# Altium schematic sheet Altium_Schematic.schdoc (part 6 of 6)
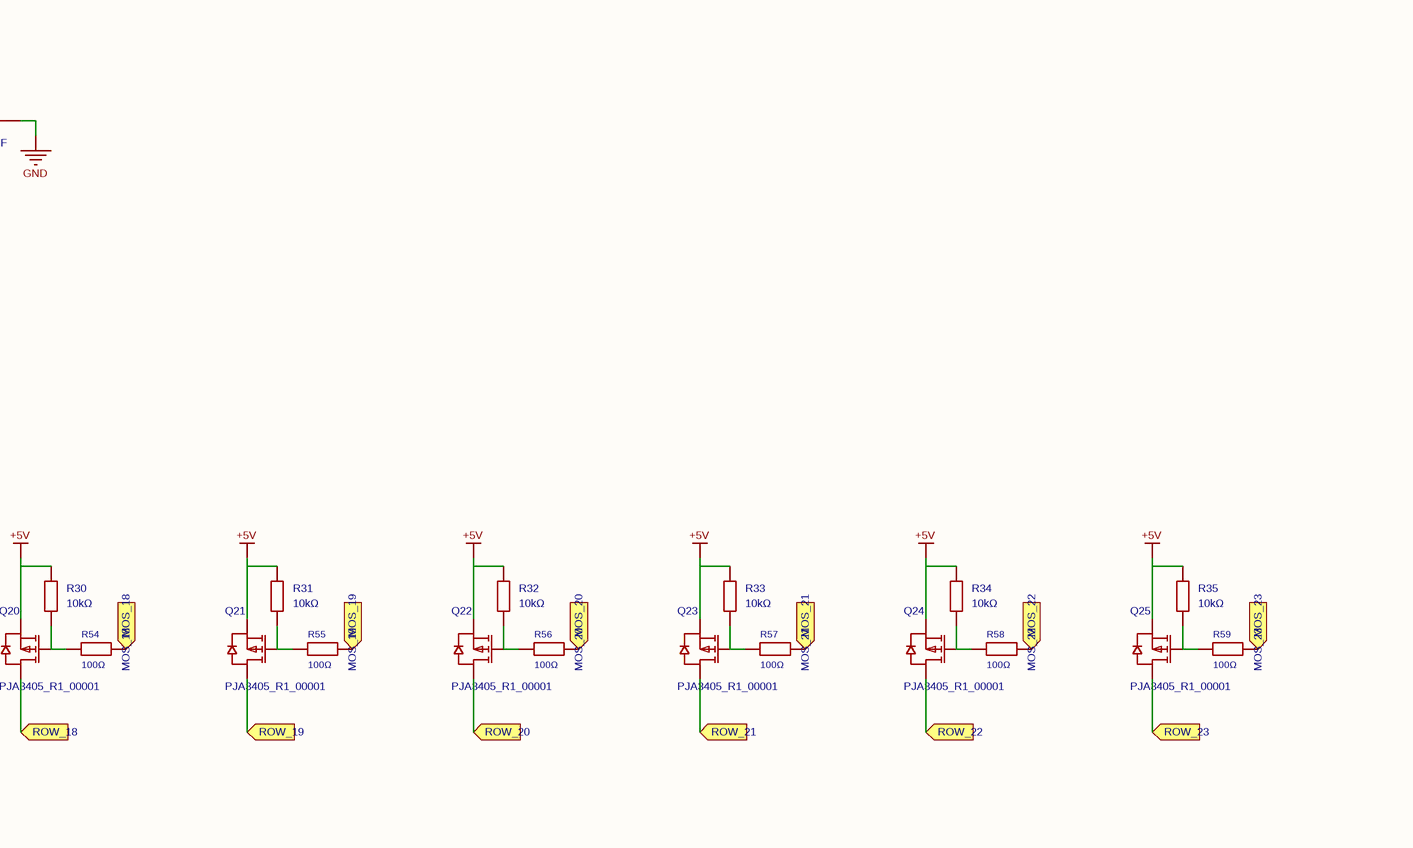
[diagram p16: Altium_Schematic.schdoc, bottom column 4 of 4]

## Nets (continued)
ROW_20: LED1441.1(A) LED1442.1(A) LED1443.1(A) LED1444.1(A) LED1445.1(A) LED1446.1(A) LED1447.1(A) LED1448.1(A) LED1449.1(A) LED1450.1(A) LED1451.1(A) LED1452.1(A) LED1453.1(A) LED1454.1(A) LED1455.1(A) LED1456.1(A) LED1457.1(A) LED1458.1(A) LED1459.1(A) LED1460.1(A) LED1461.1(A) LED1462.1(A) LED1463.1(A) LED1464.1(A) LED1465.1(A) LED1466.1(A) LED1467.1(A) LED1468.1(A) LED1469.1(A) LED1470.1(A) LED1471.1(A) LED1472.1(A) LED1473.1(A) LED1474.1(A) LED1475.1(A) LED1476.1(A) LED1477.1(A) LED1478.1(A) LED1479.1(A) LED1480.1(A) LED1481.1(A) LED1482.1(A) LED1483.1(A) LED1484.1(A) LED1485.1(A) LED1486.1(A) LED1487.1(A) LED1488.1(A) LED1489.1(A) LED1490.1(A) LED1491.1(A) LED1492.1(A) LED1493.1(A) LED1494.1(A) LED1495.1(A) LED1496.1(A) LED1497.1(A) LED1498.1(A) LED1499.1(A) LED1500.1(A) LED1501.1(A) LED1502.1(A) LED1503.1(A) LED1504.1(A) LED1505.1(A) LED1506.1(A) LED1507.1(A) LED1508.1(A) LED1509.1(A) LED1510.1(A) LED1511.1(A) LED1512.1(A) Q22.3(D) ; port ROW_20
ROW_21: LED1513.1(A) LED1514.1(A) LED1515.1(A) LED1516.1(A) LED1517.1(A) LED1518.1(A) LED1519.1(A) LED1520.1(A) LED1521.1(A) LED1522.1(A) LED1523.1(A) LED1524.1(A) LED1525.1(A) LED1526.1(A) LED1527.1(A) LED1528.1(A) LED1529.1(A) LED1530.1(A) LED1531.1(A) LED1532.1(A) LED1533.1(A) LED1534.1(A) LED1535.1(A) LED1536.1(A) LED1537.1(A) LED1538.1(A) LED1539.1(A) LED1540.1(A) LED1541.1(A) LED1542.1(A) LED1543.1(A) LED1544.1(A) LED1545.1(A) LED1546.1(A) LED1547.1(A) LED1548.1(A) LED1549.1(A) LED1550.1(A) LED1551.1(A) LED1552.1(A) LED1553.1(A) LED1554.1(A) LED1555.1(A) LED1556.1(A) LED1557.1(A) LED1558.1(A) LED1559.1(A) LED1560.1(A) LED1561.1(A) LED1562.1(A) LED1563.1(A) LED1564.1(A) LED1565.1(A) LED1566.1(A) LED1567.1(A) LED1568.1(A) LED1569.1(A) LED1570.1(A) LED1571.1(A) LED1572.1(A) LED1573.1(A) LED1574.1(A) LED1575.1(A) LED1576.1(A) LED1577.1(A) LED1578.1(A) LED1579.1(A) LED1580.1(A) LED1581.1(A) LED1582.1(A) LED1583.1(A) LED1584.1(A) Q23.3(D) ; port ROW_21
ROW_22: LED1585.1(A) LED1586.1(A) LED1587.1(A) LED1588.1(A) LED1589.1(A) LED1590.1(A) LED1591.1(A) LED1592.1(A) LED1593.1(A) LED1594.1(A) LED1595.1(A) LED1596.1(A) LED1597.1(A) LED1598.1(A) LED1599.1(A) LED1600.1(A) LED1601.1(A) LED1602.1(A) LED1603.1(A) LED1604.1(A) LED1605.1(A) LED1606.1(A) LED1607.1(A) LED1608.1(A) LED1609.1(A) LED1610.1(A) LED1611.1(A) LED1612.1(A) LED1613.1(A) LED1614.1(A) LED1615.1(A) LED1616.1(A) LED1617.1(A) LED1618.1(A) LED1619.1(A) LED1620.1(A) LED1621.1(A) LED1622.1(A) LED1623.1(A) LED1624.1(A) LED1625.1(A) LED1626.1(A) LED1627.1(A) LED1628.1(A) LED1629.1(A) LED1630.1(A) LED1631.1(A) LED1632.1(A) LED1633.1(A) LED1634.1(A) LED1635.1(A) LED1636.1(A) LED1637.1(A) LED1638.1(A) LED1639.1(A) LED1640.1(A) LED1641.1(A) LED1642.1(A) LED1643.1(A) LED1644.1(A) LED1645.1(A) LED1646.1(A) LED1647.1(A) LED1648.1(A) LED1649.1(A) LED1650.1(A) LED1651.1(A) LED1652.1(A) LED1653.1(A) LED1654.1(A) LED1655.1(A) LED1656.1(A) Q24.3(D) ; port ROW_22
ROW_23: LED1657.1(A) LED1658.1(A) LED1659.1(A) LED1660.1(A) LED1661.1(A) LED1662.1(A) LED1663.1(A) LED1664.1(A) LED1665.1(A) LED1666.1(A) LED1667.1(A) LED1668.1(A) LED1669.1(A) LED1670.1(A) LED1671.1(A) LED1672.1(A) LED1673.1(A) LED1674.1(A) LED1675.1(A) LED1676.1(A) LED1677.1(A) LED1678.1(A) LED1679.1(A) LED1680.1(A) LED1681.1(A) LED1682.1(A) LED1683.1(A) LED1684.1(A) LED1685.1(A) LED1686.1(A) LED1687.1(A) LED1688.1(A) LED1689.1(A) LED1690.1(A) LED1691.1(A) LED1692.1(A) LED1693.1(A) LED1694.1(A) LED1695.1(A) LED1696.1(A) LED1697.1(A) LED1698.1(A) LED1699.1(A) LED1700.1(A) LED1701.1(A) LED1702.1(A) LED1703.1(A) LED1704.1(A) LED1705.1(A) LED1706.1(A) LED1707.1(A) LED1708.1(A) LED1709.1(A) LED1710.1(A) LED1711.1(A) LED1712.1(A) LED1713.1(A) LED1714.1(A) LED1715.1(A) LED1716.1(A) LED1717.1(A) LED1718.1(A) LED1719.1(A) LED1720.1(A) LED1721.1(A) LED1722.1(A) LED1723.1(A) LED1724.1(A) LED1725.1(A) LED1726.1(A) LED1727.1(A) LED1728.1(A) Q25.3(D) ; port ROW_23
ROW_EN_OUT: Q1.3(D) R8.2 U7.13(OE#) U8.13(OE#) U9.13(OE#) ; port ROW_EN_OUT
ROW_LATCH: U6.20(IO6) U7.12(STCP) U8.12(STCP) U9.12(STCP) ; port ROW_LATCH
ROW_OE: R10.1 U6.6(IO3) ; port ROW_OE
SOUT_1: U1.22(SOUT) U2.2(SIN) ; port SOUT_1
SOUT_2: U2.22(SOUT) U3.2(SIN) ; port SOUT_2
SOUT_3: U3.22(SOUT) U4.2(SIN) ; port SOUT_3
SOUT_4: U4.22(SOUT) U5.2(SIN) ; port SOUT_4
SPI_MOSI: U1.2(SIN) U6.19(IO5) U7.14(DS) ; port SPI_MOSI
SPI_SCLK: U1.3(SCLK) U2.3(SCLK) U3.3(SCLK) U4.3(SCLK) U5.3(SCLK) U6.18(IO4) U7.11(SHCP) U8.11(SHCP) U9.11(SHCP) ; port SPI_SCLK
UNFILTERED_D+: D1.3 USB1.A6(Dp1) USB1.B6(Dp2) ; port UNFILTERED_D+
UNFILTERED_D-: D1.1 USB1.A7(Dn1) USB1.B7(Dn2) ; port UNFILTERED_D-
NetC3_2: C3.2 R7.2 U6.8(EN)
NetQ1_1: Q1.1(G) R10.2 R11.1
NetQ2_1: Q2.1(G) R12.2 R36.2
NetQ3_1: Q3.1(G) R13.2 R37.2
NetQ4_1: Q4.1(G) R14.2 R38.2
NetQ5_1: Q5.1(G) R15.2 R39.2
NetQ6_1: Q6.1(G) R16.2 R40.2
NetQ7_1: Q7.1(G) R17.2 R41.2
NetQ8_1: Q8.1(G) R18.2 R42.2
NetQ9_1: Q9.1(G) R19.2 R43.2
NetQ10_1: Q10.1(G) R20.2 R44.2
NetQ11_1: Q11.1(G) R21.2 R45.2
NetQ12_1: Q12.1(G) R22.2 R46.2
NetQ13_1: Q13.1(G) R23.2 R47.2
NetQ14_1: Q14.1(G) R24.2 R48.2
NetQ15_1: Q15.1(G) R25.2 R49.2
NetQ16_1: Q16.1(G) R26.2 R50.2
NetQ17_1: Q17.1(G) R27.2 R51.2
NetQ18_1: Q18.1(G) R28.2 R52.2
NetQ19_1: Q19.1(G) R29.2 R53.2
NetQ20_1: Q20.1(G) R30.2 R54.2
NetQ21_1: Q21.1(G) R31.2 R55.2
NetQ22_1: Q22.1(G) R32.2 R56.2
NetQ23_1: Q23.1(G) R33.2 R57.2
NetQ24_1: Q24.1(G) R34.2 R58.2
NetQ25_1: Q25.1(G) R35.2 R59.2
NetR1_2: R1.2 U1.23(IREF)
NetR2_2: R2.2 U2.23(IREF)
NetR3_2: R3.2 U3.23(IREF)
NetR4_2: R4.2 U4.23(IREF)
NetR5_2: R5.2 U5.23(IREF)
NetR6_2: R6.2 U6.5(IO2)
NetR9_2: R9.2 U6.23(IO9)
NetR60_2: R60.2 USB1.B5(CC2)
NetR61_2: R61.2 USB1.A5(CC1)

Not connected (* = marked no-connect by the designer): U5 13(OUT8)* 14(OUT9)* 15(OUT10)* 16(OUT11)* 17(OUT12)* 18(OUT13)* 19(OUT14)* 20(OUT15)* 22(SOUT)*; U6 4(NC)* 7(NC)* 9(NC)* 10(NC)* 15(NC)* 17(NC)* 22(IO8)* 24(NC)* 25(NC)* 28(NC)* 29(NC)* 32(NC)* 33(NC)* 34(NC)* 35(NC)*; U9 9(Q7S)*; USB1 A8(SBU1)* B8(SBU2)*

## Notes on the sheet
- Create at
- 2026-10-28
- Schematic
- Board
- Schematic1
- Board1
- Update at
- Page
- P1
- Drawn
- Reviewed
- LumaTilt
- Version
- V1.0
- Size
- A4
- Page  1  Total  1
- EasyEDA.com

## Library data of the parts
C1 C3 C9-C13 = CL05A105KP5NNNC: Capacitance:1uF Tolerance:±10% Tolerance:±10% Voltage Rating:10V Temperature Coefficient:X5R; Manufacturer: SAMSUNG(三星); AddInBom: yes; ModelId: b7d13df3e9464d7a99d0651d1a5b4d570819f05c4eef4c71ace90d822a990e87; ModelName: C0402_L1.0-W0.5-H0.5; ModelTransform: 39.37,19.685,0,0,0,0,0,0,0; Tolerance: ±10%; Voltage Rating: 10V; Temperature Coefficient: X5R; Symbol: CL05A105KP5NNNC; Device: CL05A105KP5NNNC; LCSC Part Name: 1uF ±10% 10V; SupplierPart: C14445; ManufacturerPart: CL05A105KP5NNNC; Supplier Footprint: 0402; JLCPCB Part Class: Extended Part; Datasheet: https://item.szlcsc.com/datasheet/CL05A105KP5NNNC/15107.html; Supplier: LCSC; ConvertToPcb: yes; FootprintName: C0402; Value: 1uF
C2 C4-C8 C14-C16 C20 C21 = CL05B104KB54PNC: Capacitance:100nF Tolerance:±10% Tolerance:±10% Voltage Rating:50V Temperature Coefficient:X7R; Manufacturer: SAMSUNG(三星); AddInBom: yes; ModelId: b7d13df3e9464d7a99d0651d1a5b4d570819f05c4eef4c71ace90d822a990e87; ModelName: C0402_L1.0-W0.5-H0.5; ModelTransform: 39.37,19.685,0,0,0,0,0,0,0; Tolerance: ±10%; Voltage Rating: 50V; Temperature Coefficient: X7R; Symbol: CL05B104KB54PNC; Device: CL05B104KB54PNC; LCSC Part Name: 100nF ±10% 50V; SupplierPart: C307331; ManufacturerPart: CL05B104KB54PNC; Supplier Footprint: 0402; JLCPCB Part Class: Basic Part; Datasheet: https://item.szlcsc.com/datasheet/CL05B104KB54PNC/291005.html; Supplier: LCSC; ConvertToPcb: yes; FootprintName: C0402; Value: 100nF
C17 C19 = CL21A106KAYNNNE_C15850: Capacitance:10uF Tolerance:±10% Tolerance:±10% Voltage Rating:25V Temperature Coefficient:X5R; Manufacturer: SAMSUNG(三星); AddInBom: yes; ModelId: 8c88e81f49c6409b980720ec8953afb60819f05c4eef4c71ace90d822a990e87; ModelName: C0805_L2.0-W1.3-H1.3; ModelTransform: 78.74,51.181,0,0,0,0,0,0.0005,0; Tolerance: ±10%; Voltage Rating: 25V; Temperature Coefficient: X5R; Symbol: CL21A106KAYNNNE; Device: CL21A106KAYNNNE_C15850; LCSC Part Name: 10uF ±10% 25V; SupplierPart: C15850; ManufacturerPart: CL21A106KAYNNNE; Supplier Footprint: 0805; JLCPCB Part Class: Basic Part; Datasheet: https://item.szlcsc.com/datasheet/CL21A106KAYNNNE/16532.html; Supplier: LCSC; ConvertToPcb: yes; FootprintName: C0805; Value: 10uF
C18 = CL21A226MAQNNNE: Capacitance:22uF Tolerance:±20% Tolerance:±20% Voltage Rating:25V Temperature Coefficient:X5R; Manufacturer: SAMSUNG(三星); AddInBom: yes; ModelId: 8c88e81f49c6409b980720ec8953afb60819f05c4eef4c71ace90d822a990e87; ModelName: C0805_L2.0-W1.3-H1.3; ModelTransform: 78.74,51.181,0,0,0,0,0,0.0005,0; Tolerance: ±20%; Voltage Rating: 25V; Temperature Coefficient: X5R; Symbol: CL21A226MAQNNNE; Device: CL21A226MAQNNNE; LCSC Part Name: 22uF ±20% 25V; SupplierPart: C45783; ManufacturerPart: CL21A226MAQNNNE; Supplier Footprint: 0805; JLCPCB Part Class: Basic Part; Datasheet: https://item.szlcsc.com/datasheet/CL21A226MAQNNNE/46786.html; Supplier: LCSC; ConvertToPcb: yes; FootprintName: C0805; Value: 22uF
D1 = USBLC6-2SC6_C7519: Polarity:Unidirectional Reverse Stand-Off Voltage (Vrwm):5.25V Clamping Voltage:17V Peak Pulse Current (Ipp):5A Voltage - Breakdown:6V Reverse Leakage Current (Ir):150nA Number of Channels:2 Operating Temperature:-40℃~+125℃ Operating Temperature:-40℃~+125; Manufacturer: ST(意法半导体); AddInBom: yes; ModelId: 1370be37a17e44418ae52e2b4cc1f5e50819f05c4eef4c71ace90d822a990e87; ModelName: SOT-23-6_L2.9-W1.6-H1.5-LS2.8-P0.95; ModelTransform: 110.236,113.364,0,90,0,0,0.0005,0.0005,0; Reverse Stand-Off Voltage (Vrwm): 5.25V; Clamping Voltage: 17V; Peak Pulse Current (Ipp): 5A; Voltage - Breakdown: 6V; Reverse Leakage Current (Ir): 150nA; Number of Channels: 2; level of protection: IEC 61000-4-2; Type: ESD; Junction Capacitance: 3.5pF; Symbol: USBLC6-2SC6; Device: USBLC6-2SC6_C7519; LCSC Part Name: 单向ESD 5.25V截止 峰值脉冲电流：5A; SupplierPart: C7519; ManufacturerPart: USBLC6-2SC6; Supplier Footprint: SOT-23-6L; JLCPCB Part Class: Extended Part; Datasheet: https://item.szlcsc.com/datasheet/USBLC6-2SC6/7996.html; Supplier: LCSC; ConvertToPcb: yes; FootprintName: SOT-23-6_L2.9-W1.6-P0.95-LS2.8-BL; Polarity: Unidirectional; Operating Temperature: -40℃~+125℃
H1 H2 = HDR-M_2.54_1x3P: Symbol: PZ254V-11-03P_C2937625; ConvertToPcb: yes; ModelId: b83490ae987a4919a987f9b45fc060bc0819f05c4eef4c71ace90d822a990e87; ModelName: HDR-TH_3P-P2.54-M-LI-1X3P; ModelTransform: 300.03877,100,0,0,0,0,0,0,-118.11; Device: HDR-M_2.54_1x3P; AddInBom: yes; Supplier Footprint: Through; FootprintName: Top side pads
LED1-LED1728 = 16-213/BHC-AN1P2/3T: Lamp Holder Type:- Illumination Color:Blue Voltage - Forward(Vf):3.3V Voltage - Forward(Vf):3.3V Power(Watts):95mW Forward Current:20mA Wavelength - Dominant:471nm Wavelength - Dominant:471nm Peak Wavelength:468nm Diode Configuration:Discrete Diode Lens C; Manufacturer: EVERLIGHT(亿光); AddInBom: yes; ModelId: 1be5ebcfced448aeb54284ccf02a9a280819f05c4eef4c71ace90d822a990e87; ModelName: LED0402_L1.0-W0.5-H0.4; ModelTransform: 40.1574,19.685,0,0,0,0,0,0,0; Illumination Color: Blue; Voltage - Forward(Vf): 3.3V; Power(Watts): 95mW; Forward Current: 20mA; Wavelength - Dominant: 471nm; Peak Wavelength: 468nm; Lens Color: Water Clear; Luminous Intensity: 50.25mcd; Viewing Angle: 120°; Symbol: 16-213/BHC-AN1P2/3T; Device: 16-213/BHC-AN1P2/3T; LCSC Part Name: 蓝灯; SupplierPart: C131223; ManufacturerPart: 16-213/BHC-AN1P2/3T; Supplier Footprint: 0402; JLCPCB Part Class: Extended Part; Datasheet: https://en.everlight.com/wp-content/plugins/ItemRelationship/product_files/pdf/16-213-BHC-AN1P2-3T.pdf; Supplier: LCSC; ConvertToPcb: yes; FootprintName: LED0402-R-RD; Lamp Holder Type: -; Diode Configuration: Discrete Diode; Color Temperature: -; Mounting Style: -; Operating Temperature: -40℃~+85℃
Q1 = 2N7002ET1G: Number:1 N-channel Drain to Source Voltage:60V Current - Continuous Drain(Id):310mA RDS(on):3Ω@4.5V Pd - Power Dissipation:300mW Gate Threshold Voltage (Vgs(th)):2.5V Gate Charge(Qg):810pC@10V Input Capacitance(Ciss):40pF Reverse Transfer Capacitance (Crs; Manufacturer: onsemi(安森美); AddInBom: yes; ModelId: 4eed685bb9f4439b846746bc2193f3c00819f05c4eef4c71ace90d822a990e87; ModelName: SOT-23-3L_L2.9-W1.6-H1.1-LS2.8-P0.95; ModelTransform: 114.173,110.236,0,90,0,0,0,0,0; Drain to Source Voltage: 60V; Current - Continuous Drain(Id): 310mA; Pd - Power Dissipation: 300mW; Gate Threshold Voltage (Vgs(th)): 2.5V; Input Capacitance(Ciss): 40pF; Reverse Transfer Capacitance (Crss@Vds): 2.9pF; Output Capacitance(Coss): 4.6pF; Vgs: ±20V; Symbol: 2N7002ET1G; Device: 2N7002ET1G; LCSC Part Name: 1个N沟道 耐压:60V 电流:310mA; SupplierPart: C71533; ManufacturerPart: 2N7002ET1G; Supplier Footprint: SOT-23; JLCPCB Part Class: Extended Part; Datasheet: https://item.szlcsc.com/datasheet/2N7002ET1G/72641.html; Supplier: LCSC; ConvertToPcb: yes; FootprintName: SOT-23-3_L2.9-W1.6-P1.90-LS2.8-BR; Number: 1 N-channel; RDS(on): 3Ω@4.5V; Gate Charge(Qg): 810pC@10V; Operating Temperature: -55℃~+150℃; Configuration: -; Type: N-Channel
Q2-Q25 = PJA3405_R1_00001: Number:1 P-Channel Drain to Source Voltage:30V Current - Continuous Drain(Id):3.6A RDS(on):73mΩ@10V Pd - Power Dissipation:1.25W Gate Threshold Voltage (Vgs(th)):2.1V Gate Charge(Qg):10nC@10V Input Capacitance(Ciss):417pF Reverse Transfer Capacitance (Crs; Manufacturer: PANJIT(强茂); AddInBom: yes; ModelId: 62a57c6760504a01965db6419a6d07df0819f05c4eef4c71ace90d822a990e87; ModelName: SOT-23-3P_L2.9-W1.3-H1.0-LS2.4-P0.95; ModelTransform: 98.64468,114.173,0,180,0,0,0.001,-0.002,0; Drain to Source Voltage: 30V; Current - Continuous Drain(Id): 3.6A; Pd - Power Dissipation: 1.25W; Gate Threshold Voltage (Vgs(th)): 2.1V; Input Capacitance(Ciss): 417pF; Reverse Transfer Capacitance (Crss@Vds): 36pF; Output Capacitance(Coss): 50pF; Vgs: ±20V; Symbol: PJA3405_R1_00001; Device: PJA3405_R1_00001; LCSC Part Name: 1个P沟道 耐压:30V 电流:3.6A; SupplierPart: C391632; ManufacturerPart: PJA3405_R1_00001; Supplier Footprint: SOT-23; JLCPCB Part Class: Extended Part; Datasheet: https://item.szlcsc.com/datasheet/PJA3405_R1_00001/368309.html; Supplier: LCSC; ConvertToPcb: yes; FootprintName: SOT-23_L2.9-W1.3-P1.90-LS2.4-BR; Number: 1 P-Channel; RDS(on): 73mΩ@10V; Gate Charge(Qg): 10nC@10V; Operating Temperature: -55℃~+150℃; Configuration: -; Type: P-Channel
R1-R9 R11-R35 = 0402WGF1002TCE: Type:Thick Film Resistor Resistance:10kΩ Tolerance:±1% Tolerance:±1% Power(Watts):62.5mW Voltage-Supply(Max):50V Temperature Coefficient:±100ppm/℃ Temperature Coefficient:±100ppm/℃ Operating Temperature:-55℃~+155℃ Operating Temperature:-55℃~+155℃; Manufacturer: UNI-ROYAL(厚声); AddInBom: yes; ModelId: efdecb7dae4442949d28eecaf748420f0819f05c4eef4c71ace90d822a990e87; ModelName: R0402_L1.0-W0.5-H0.4; ModelTransform: 39.37,19.685,0,0,0,0,0,0,0; Tolerance: ±1%; Power(Watts): 62.5mW; Voltage-Supply(Max): 50V; Symbol: 0402WGF1002TCE; Device: 0402WGF1002TCE; LCSC Part Name: 厚膜电阻 10kΩ ±1%; SupplierPart: C25744; ManufacturerPart: 0402WGF1002TCE; Supplier Footprint: 0402; JLCPCB Part Class: Basic Part; Datasheet: https://item.szlcsc.com/datasheet/0402WGF1002TCE/26487.html; Supplier: LCSC; ConvertToPcb: yes; FootprintName: R0402; Type: Thick Film Resistor; Value: 10kΩ; Temperature Coefficient: ±100ppm/℃; Operating Temperature: -55℃~+155℃
R10 R36-R59 = 0402WGF1000TCE: Type:Thick Film Resistor Resistance:100Ω Tolerance:±1% Tolerance:±1% Power(Watts):62.5mW Voltage-Supply(Max):50V Temperature Coefficient:±100ppm/℃ Temperature Coefficient:±100ppm/℃ Operating Temperature:-55℃~+155℃ Operating Temperature:-55℃~+155℃; Manufacturer: UNI-ROYAL(厚声); AddInBom: yes; ModelId: efdecb7dae4442949d28eecaf748420f0819f05c4eef4c71ace90d822a990e87; ModelName: R0402_L1.0-W0.5-H0.4; ModelTransform: 39.37,19.685,0,0,0,0,0,0,0; Tolerance: ±1%; Power(Watts): 62.5mW; Voltage-Supply(Max): 50V; Symbol: 0402WGF1000TCE; Device: 0402WGF1000TCE; LCSC Part Name: 厚膜电阻 100Ω ±1%; SupplierPart: C25076; ManufacturerPart: 0402WGF1000TCE; Supplier Footprint: 0402; JLCPCB Part Class: Basic Part; Datasheet: https://item.szlcsc.com/datasheet/0402WGF1000TCE/25819.html; Supplier: LCSC; ConvertToPcb: yes; FootprintName: R0402; Type: Thick Film Resistor; Value: 100Ω; Temperature Coefficient: ±100ppm/℃; Operating Temperature: -55℃~+155℃
R60 R61 = 0402WGF5101TCE: Type:Thick Film Resistor Resistance:5.1kΩ Tolerance:±1% Tolerance:±1% Power(Watts):62.5mW Voltage-Supply(Max):50V Temperature Coefficient:±100ppm/℃ Temperature Coefficient:±100ppm/℃ Operating Temperature:-55℃~+155℃ Operating Temperature:-55℃~+155℃; Manufacturer: UNI-ROYAL(厚声); AddInBom: yes; ModelId: efdecb7dae4442949d28eecaf748420f0819f05c4eef4c71ace90d822a990e87; ModelName: R0402_L1.0-W0.5-H0.4; ModelTransform: 39.37,19.685,0,0,0,0,0,0,0; Tolerance: ±1%; Power(Watts): 62.5mW; Voltage-Supply(Max): 50V; Symbol: 0402WGF5101TCE; Device: 0402WGF5101TCE; Supplier: LCSC; Manufacturer Part: 0402WGF5101TCE; Supplier Part: C25905; Value: 5.1kΩ; JLCPCB Part Class: Basic Part; LCSC Part Name: 厚膜电阻 5.1kΩ ±1%; Supplier Footprint: 0402; Datasheet: https://item.szlcsc.com/datasheet/0402WGF5101TCE/26648.html; ConvertToPcb: yes; FootprintName: R0402; Type: Thick Film Resistor; Temperature Coefficient: ±100ppm/℃; Operating Temperature: -55℃~+155℃
SW1 = SKPMDAE011: Circuit:SPST Actuator Style:Rectangular Button Mounting Type:Surface Mount,Vertical Length:6.6mm Width:6mm Switch Height:5mm With Lamp:- Life:-; Manufacturer: ALPSALPINE(阿尔卑斯阿尔派); AddInBom: yes; ModelId: 46c005ffd25e437ead8beb83865ad8ba0819f05c4eef4c71ace90d822a990e87; ModelTransform: 255.905,236.22,0,0,0,0,0,0,0; Circuit: SPST; Switch Height: 5mm; Symbol: SKPMDAE011; Device: SKPMDAE011; Supplier: LCSC; Supplier Part: C370971; Manufacturer Part: SKPMDAE011; JLCPCB Part Class: Extended Part; LCSC Part Name: 6.6*6*5mm 立贴 轻触开关; Supplier Footprint: SMD,6x6mm; Datasheet: https://item.szlcsc.com/datasheet/SKPMDAE011/344655.html; ConvertToPcb: yes; FootprintName: SW-SMD_L6.0-W6.0-LS6.6; ModelName: SW-SMD_L6.0-W6.0-LS6.6; Actuator Style: Rectangular Button; Mounting Type: Surface Mount,Vertical; Length: 6.6mm; Width: 6mm; With Lamp: -; Life: -
U1-U5 = TLC59282DBQR: Type:- Voltage - Input(DC):3V~5.5V Voltage - Input(DC):3V~5.5V Frequency - Switching:35MHz Frequency - Switching:35MHz Number of Channels:16 Output Voltage:17V Output Voltage:17V Output Current:45mA Dimming:- Features:- Voltage - Input(AC):- Voltage - Inp; Manufacturer: TI(德州仪器); AddInBom: yes; ModelId: 4afe18c97a6b45ceb5660a9e5cf367bb0819f05c4eef4c71ace90d822a990e87; ModelName: SSOP-24_L8.7_W3.9-H1.7-LS6.0-P0.64; ModelTransform: 240.39054,342.519,0,90,0,0,0,-0.0005,0; Frequency - Switching: 35MHz; Number of Channels: 16; Output Voltage: 17V; Output Current: 45mA; Switch Tube (Built-In/External): Built-in; Constant Current Accuracy: 2%; Symbol: TLC59282DBQR; Device: TLC59282DBQR; LCSC Part Name: 16 通道恒流 LED 驱动器，带 4 通道分组延迟; SupplierPart: C129352; ManufacturerPart: TLC59282DBQR; Supplier Footprint: SSOP-24-150mil; JLCPCB Part Class: Extended Part; Datasheet: https://www.ti.com/cn/lit/ds/symlink/tlc59282.pdf; Supplier: LCSC; ConvertToPcb: yes; FootprintName: SSOP-24_L8.8-W4.0-P0.64-LS6.2-BL; Type: -; Voltage - Input(DC): 3V~5.5V; Dimming: -; Features: -; Voltage - Input(AC): -; Topology: -; Operating temperature: -40℃~+85℃
U6 = ESP32-C3-MINI-1-N4: Model:Transceiver Output Power(Max):20.5dBm Output Power(Max):20.5dBm Interface Type:SPI；UART；I2S；I2C；USB Voltage - Supply:3V~3.6V Voltage - Supply:3V~3.6V Antenna Type:On-board PCB Antenna Receive  Current:84mA Send  Current:350mA Sensitivity:-98dBm Sens; Manufacturer: ESPRESSIF(乐鑫); AddInBom: yes; ModelId: 94355d76a97f49a087f422f34422bfc00819f05c4eef4c71ace90d822a990e87; ModelTransform: 519.684,653.542,0,0,0,0,0,106.89,0; Receive  Current: 84mA; Send  Current: 350mA; Sensitivity: -98dBm; Symbol: ESP32-C3-MINI-1-N4; Device: ESP32-C3-MINI-1-N4; LCSC Part Name: 不带固件 支持2.4GHz Wi-Fi和蓝牙5的小尺寸模组; SupplierPart: C2838502; ManufacturerPart: ESP32-C3-MINI-1-N4; Supplier Footprint: SMD,16.6x13.2mm; JLCPCB Part Class: Extended Part; Datasheet: https://item.szlcsc.com/datasheet/ESP32-C3-MINI-1-N4/3013227.html; Supplier: LCSC; ConvertToPcb: yes; FootprintName: WIFIM-SMD_ESP32-C3-MINI-1; ModelName: WIFIM-SMD_ESP32-C3-MINI-1; Model: Transceiver; Output Power(Max): 20.5dBm; Interface Type: SPI；UART；I2S；I2C；USB; Voltage - Supply: 3V~3.6V; Antenna Type: On-board PCB Antenna; Operating Temperature: -40℃~+85℃; Features: Integrated antenna；Built-in watchdog；Integrated temperature sensor
U7-U9 = 74HCT595BQ,115: Function:Serial-to-Serial or Parallel Voltage - Supply:4.5V~5.5V Voltage - Supply:4.5V~5.5V Clock Frequency:52MHz Number of Elements:1 Output Type:Tri-State Series:74HCT Pd - Power Dissipation:- Propagation Delay:24ns@4.5V,50pF Output Current:6mA Resoluti; Manufacturer: Nexperia(安世); AddInBom: yes; ModelId: 4d99e87425fb42edb4baf01ea152fcef0819f05c4eef4c71ace90d822a990e87; ModelName: DHVQFN-16_L3.5-W2.5-H1.0-P0.50; ModelTransform: 138.5824,99.2124,0,0,0,0,0,0,0; Clock Frequency: 52MHz; Number of Elements: 1; Output Current: 6mA; Resolution: 8; Input Type: TTL-compatible CMOS; Symbol: 74HCT595BQ,115; Device: 74HCT595BQ,115; LCSC Part Name: 三态输出，带输出锁存器的8位串行输入、串行或并行输出移位寄存器; SupplierPart: C99709; ManufacturerPart: 74HCT595BQ,115; Supplier Footprint: DHVQFN-16(2.5x3.5); JLCPCB Part Class: Extended Part; Datasheet: https://item.szlcsc.com/datasheet/74HCT595BQ%252C115/100923.html; Supplier: LCSC; ConvertToPcb: yes; FootprintName: DHVQFN-16_L3.5-W2.5-P0.50-BL-EP; Function: Serial-to-Serial or Parallel; Voltage - Supply: 4.5V~5.5V; Output Type: Tri-State; Series: 74HCT; Pd - Power Dissipation: -; Propagation Delay: 24ns@4.5V,50pF; Current - Output Low(IOL): 6mA; Current - Output High(IOH): 6mA; Operating Temperature: -40℃~+125℃; Features: Asynchronous clear function；Output enable
U10 = AMS1117-3.3_C6186: Output Configuration:Positive Voltage - Supply:15V Output Voltage:3.3V Output Voltage:3.3V Output Current:1A Power Supply Rejection Ratio (PSRR):72dB@(120Hz) Voltage Dropout:1.1V@(800mA) standby current:5mA Noise:0.003%Vout Features:Short Circuit Protecti; Manufacturer: Advanced Monolithic Systems; AddInBom: yes; ModelId: e5f8b32b785646b6abbef6d5ae2fe0600819f05c4eef4c71ace90d822a990e87; ModelName: SOT-223-4P_L6.5-W3.5-H1.6-LS7.0-P2.30; ModelTransform: 279.89794,255.905,0,180,0,0,-3.9385,-0.0005,0; Voltage - Supply: 15V; Output Voltage: 3.3V; Output Current: 1A; standby current: 5mA; Output Type: Fixed; Number of Outputs: 1; Symbol: AMS1117-3.3; Device: AMS1117-3.3_C6186; LCSC Part Name: 3.3V 1A 15V; SupplierPart: C6186; ManufacturerPart: AMS1117-3.3; Supplier Footprint: SOT-223; JLCPCB Part Class: Basic Part; Datasheet: https://item.szlcsc.com/datasheet/AMS1117-3.3/6652.html; Supplier: LCSC; ConvertToPcb: yes; FootprintName: SOT-223-3_L6.5-W3.4-P2.30-LS7.0-BR; Output Configuration: Positive; Power Supply Rejection Ratio (PSRR): 72dB@(120Hz); Voltage Dropout: 1.1V@(800mA); Noise: 0.003%Vout; Features: Short Circuit Protection；Thermal shutdown；Over Current Protection; Operating Temperature: -40℃~+125℃
USB1 = TYPE-C 16PIN 2MD(073): Connector Type:Type-C Protocol Standard:- Gender:Female Mounting Type:Surface Mount, Right Angle Number of Contacts:16P Number of Ports:1 Current Rating-Power:3A Voltage Rating:5V Connect-Disconnect Life:10,000 cycles Supplementary Features:- Center Heigh; Manufacturer: SHOU HAN(首韩); AddInBom: yes; ModelId: e7514eef573e45b68df9e9a6124b25320819f05c4eef4c71ace90d822a990e87; ModelName: USB-C-SMD_TYPE-C-6PIN-2MD-073; ModelTransform: 351.9678,298.4246,0,0,0,0,0,-47.244,-35.433; Gender: Female; Number of Contacts: 16P; Number of Ports: 1; Current Rating-Power: 3A; Voltage Rating: 5V; Detection color: Black; Symbol: TYPE-C 16PIN 2MD(073); Device: TYPE-C 16PIN 2MD(073); LCSC Part Name: Type-C 母 卧贴; SupplierPart: C2765186; ManufacturerPart: TYPE-C 16PIN 2MD(073); Supplier Footprint: SMD; JLCPCB Part Class: Extended Part; Datasheet: https://item.szlcsc.com/datasheet/TYPE-C%252016PIN%25202MD(073)/2901843.html; Supplier: LCSC; ConvertToPcb: yes; FootprintName: USB-C-SMD_TYPE-C-16PIN-2MD-073; Connector Type: Type-C; Protocol Standard: -; Mounting Type: Surface Mount, Right Angle; Connect-Disconnect Life: 10,000 cycles; Supplementary Features: -; Center Height: -; Length: 7.35mm; Operating Temperature: -25℃~+85℃